# EasyEDA Pro project Rear_ESP32S3_R26.epro, schematic Rear_Mainboard_ESP32S3_V0.3, sheets 3 to 5 of 5

## Sheets
3 03_GSR_AFE_ADC: Schematic Name: Rear_Mainboard_V0.1
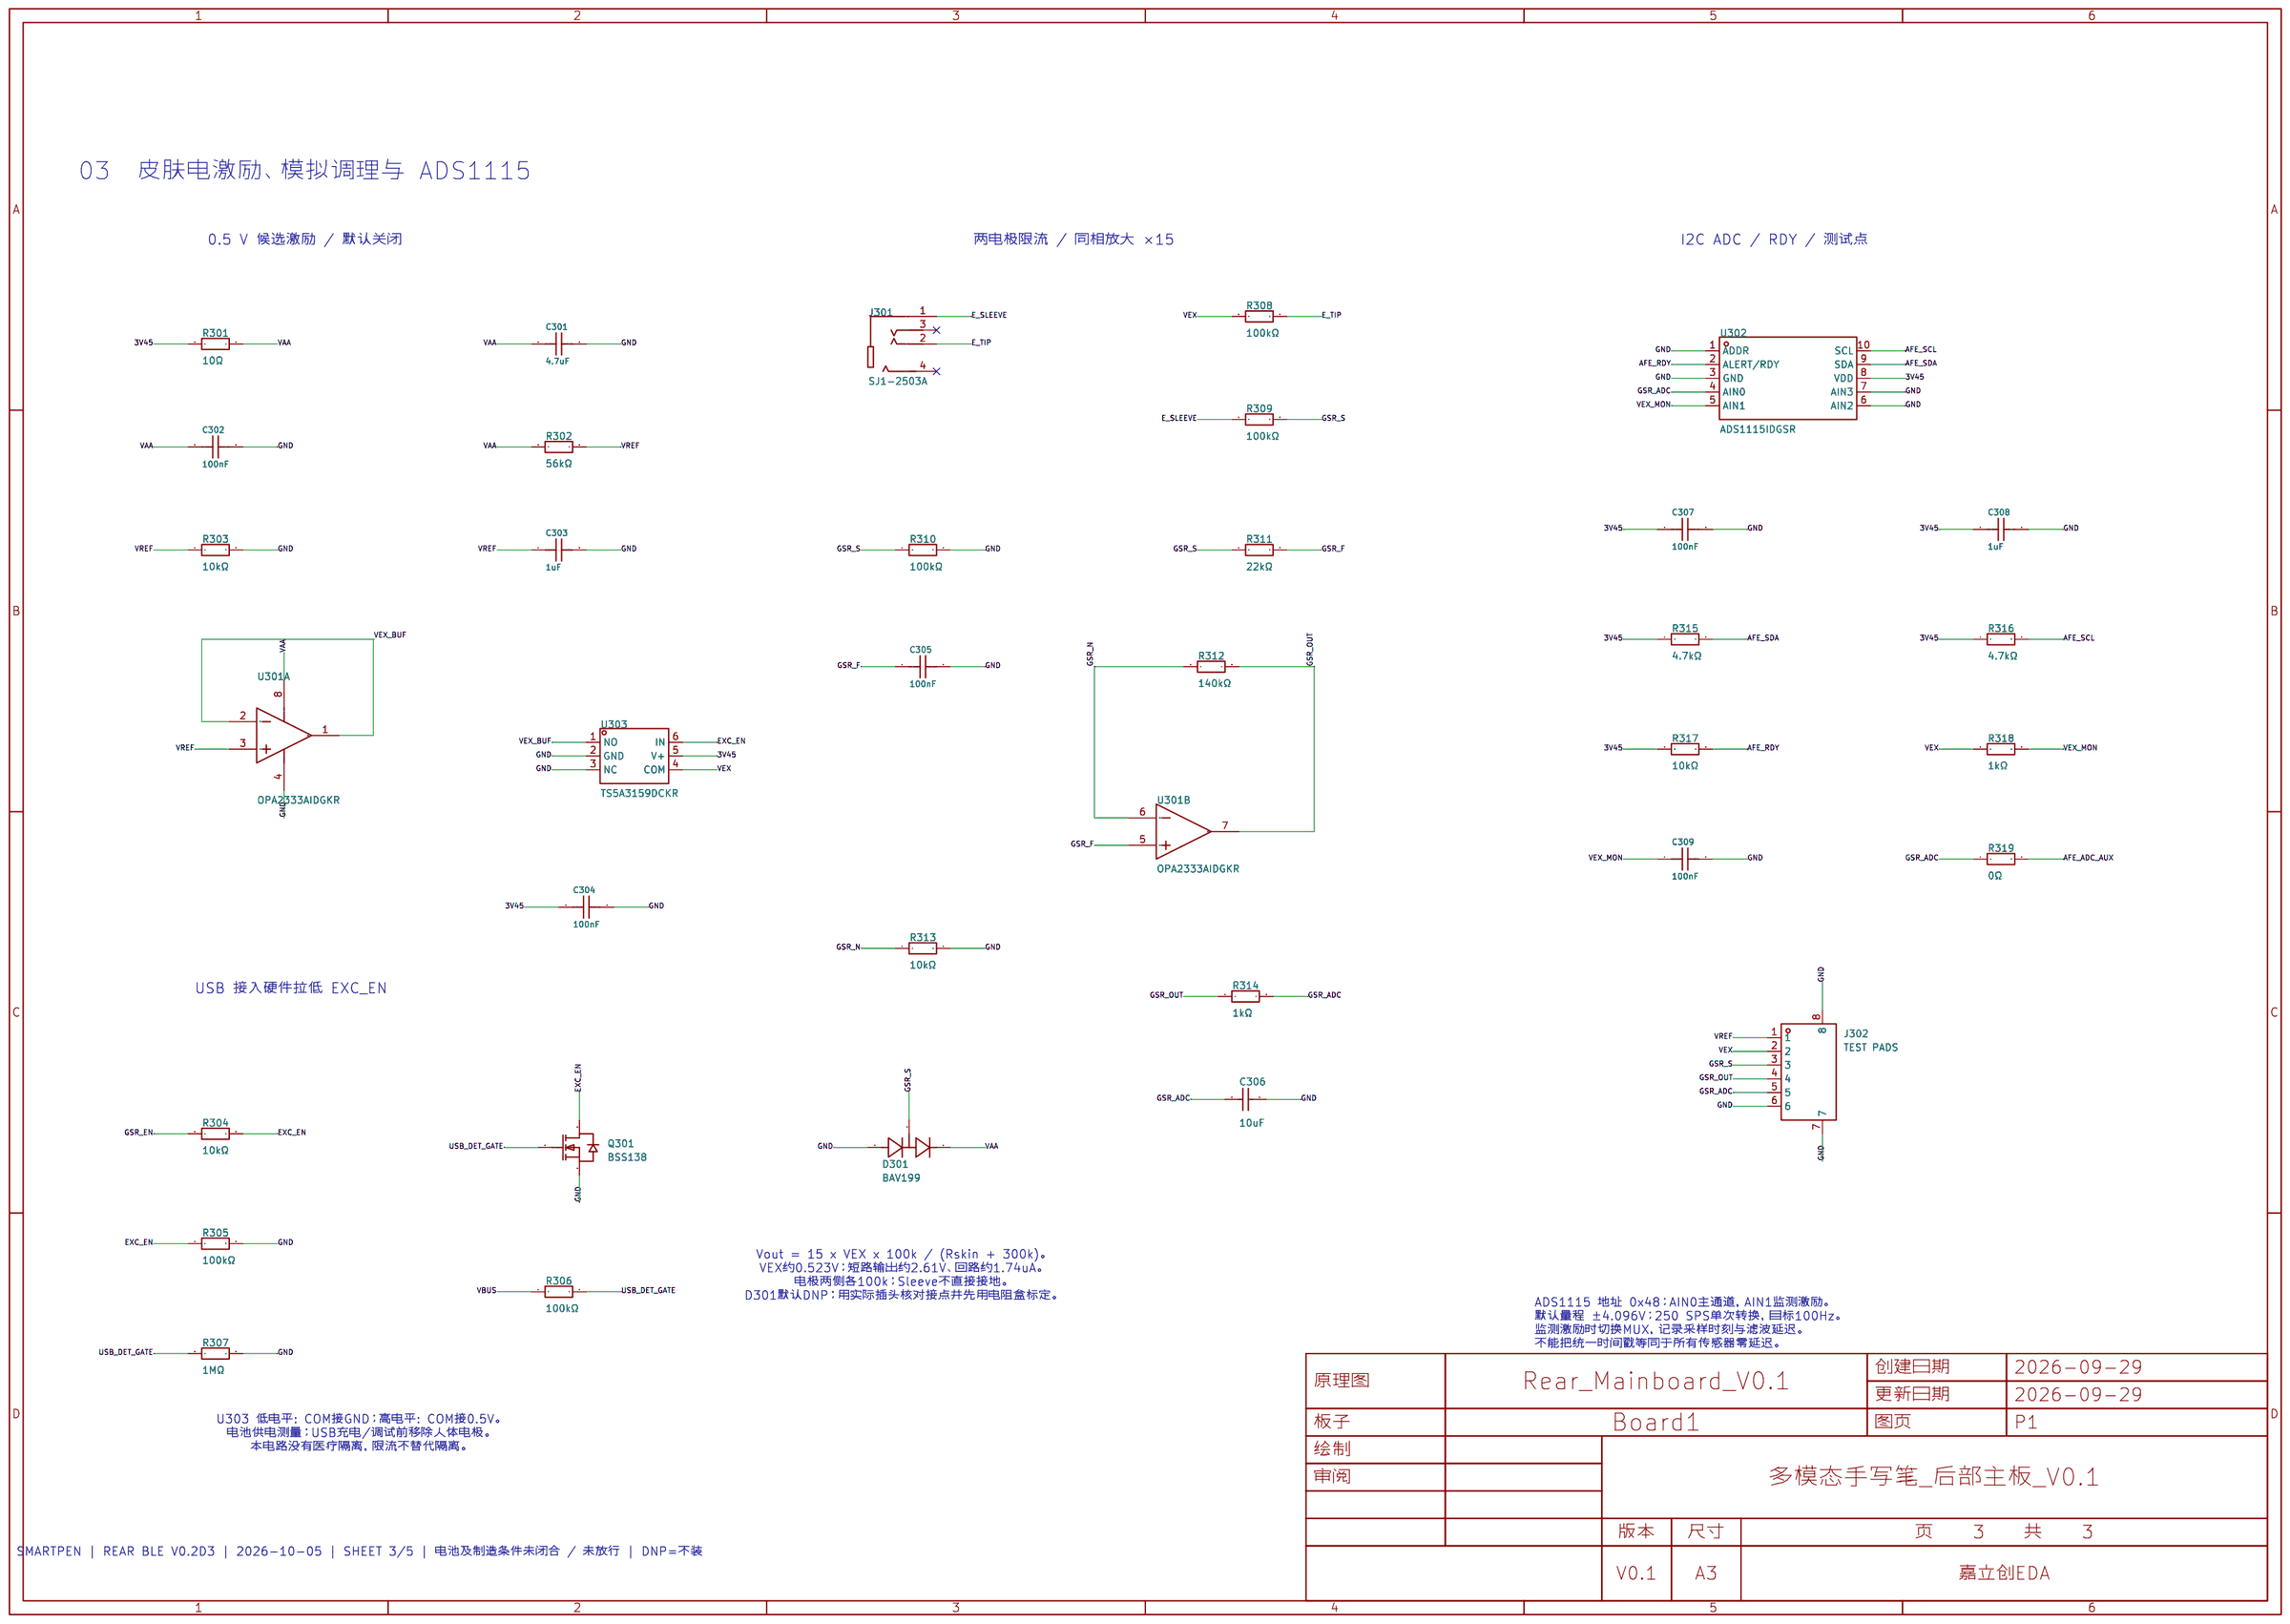
[diagram p2: 03_GSR_AFE_ADC]
4 04_Sensors: Schematic Name: Rear_Mainboard_V0.1
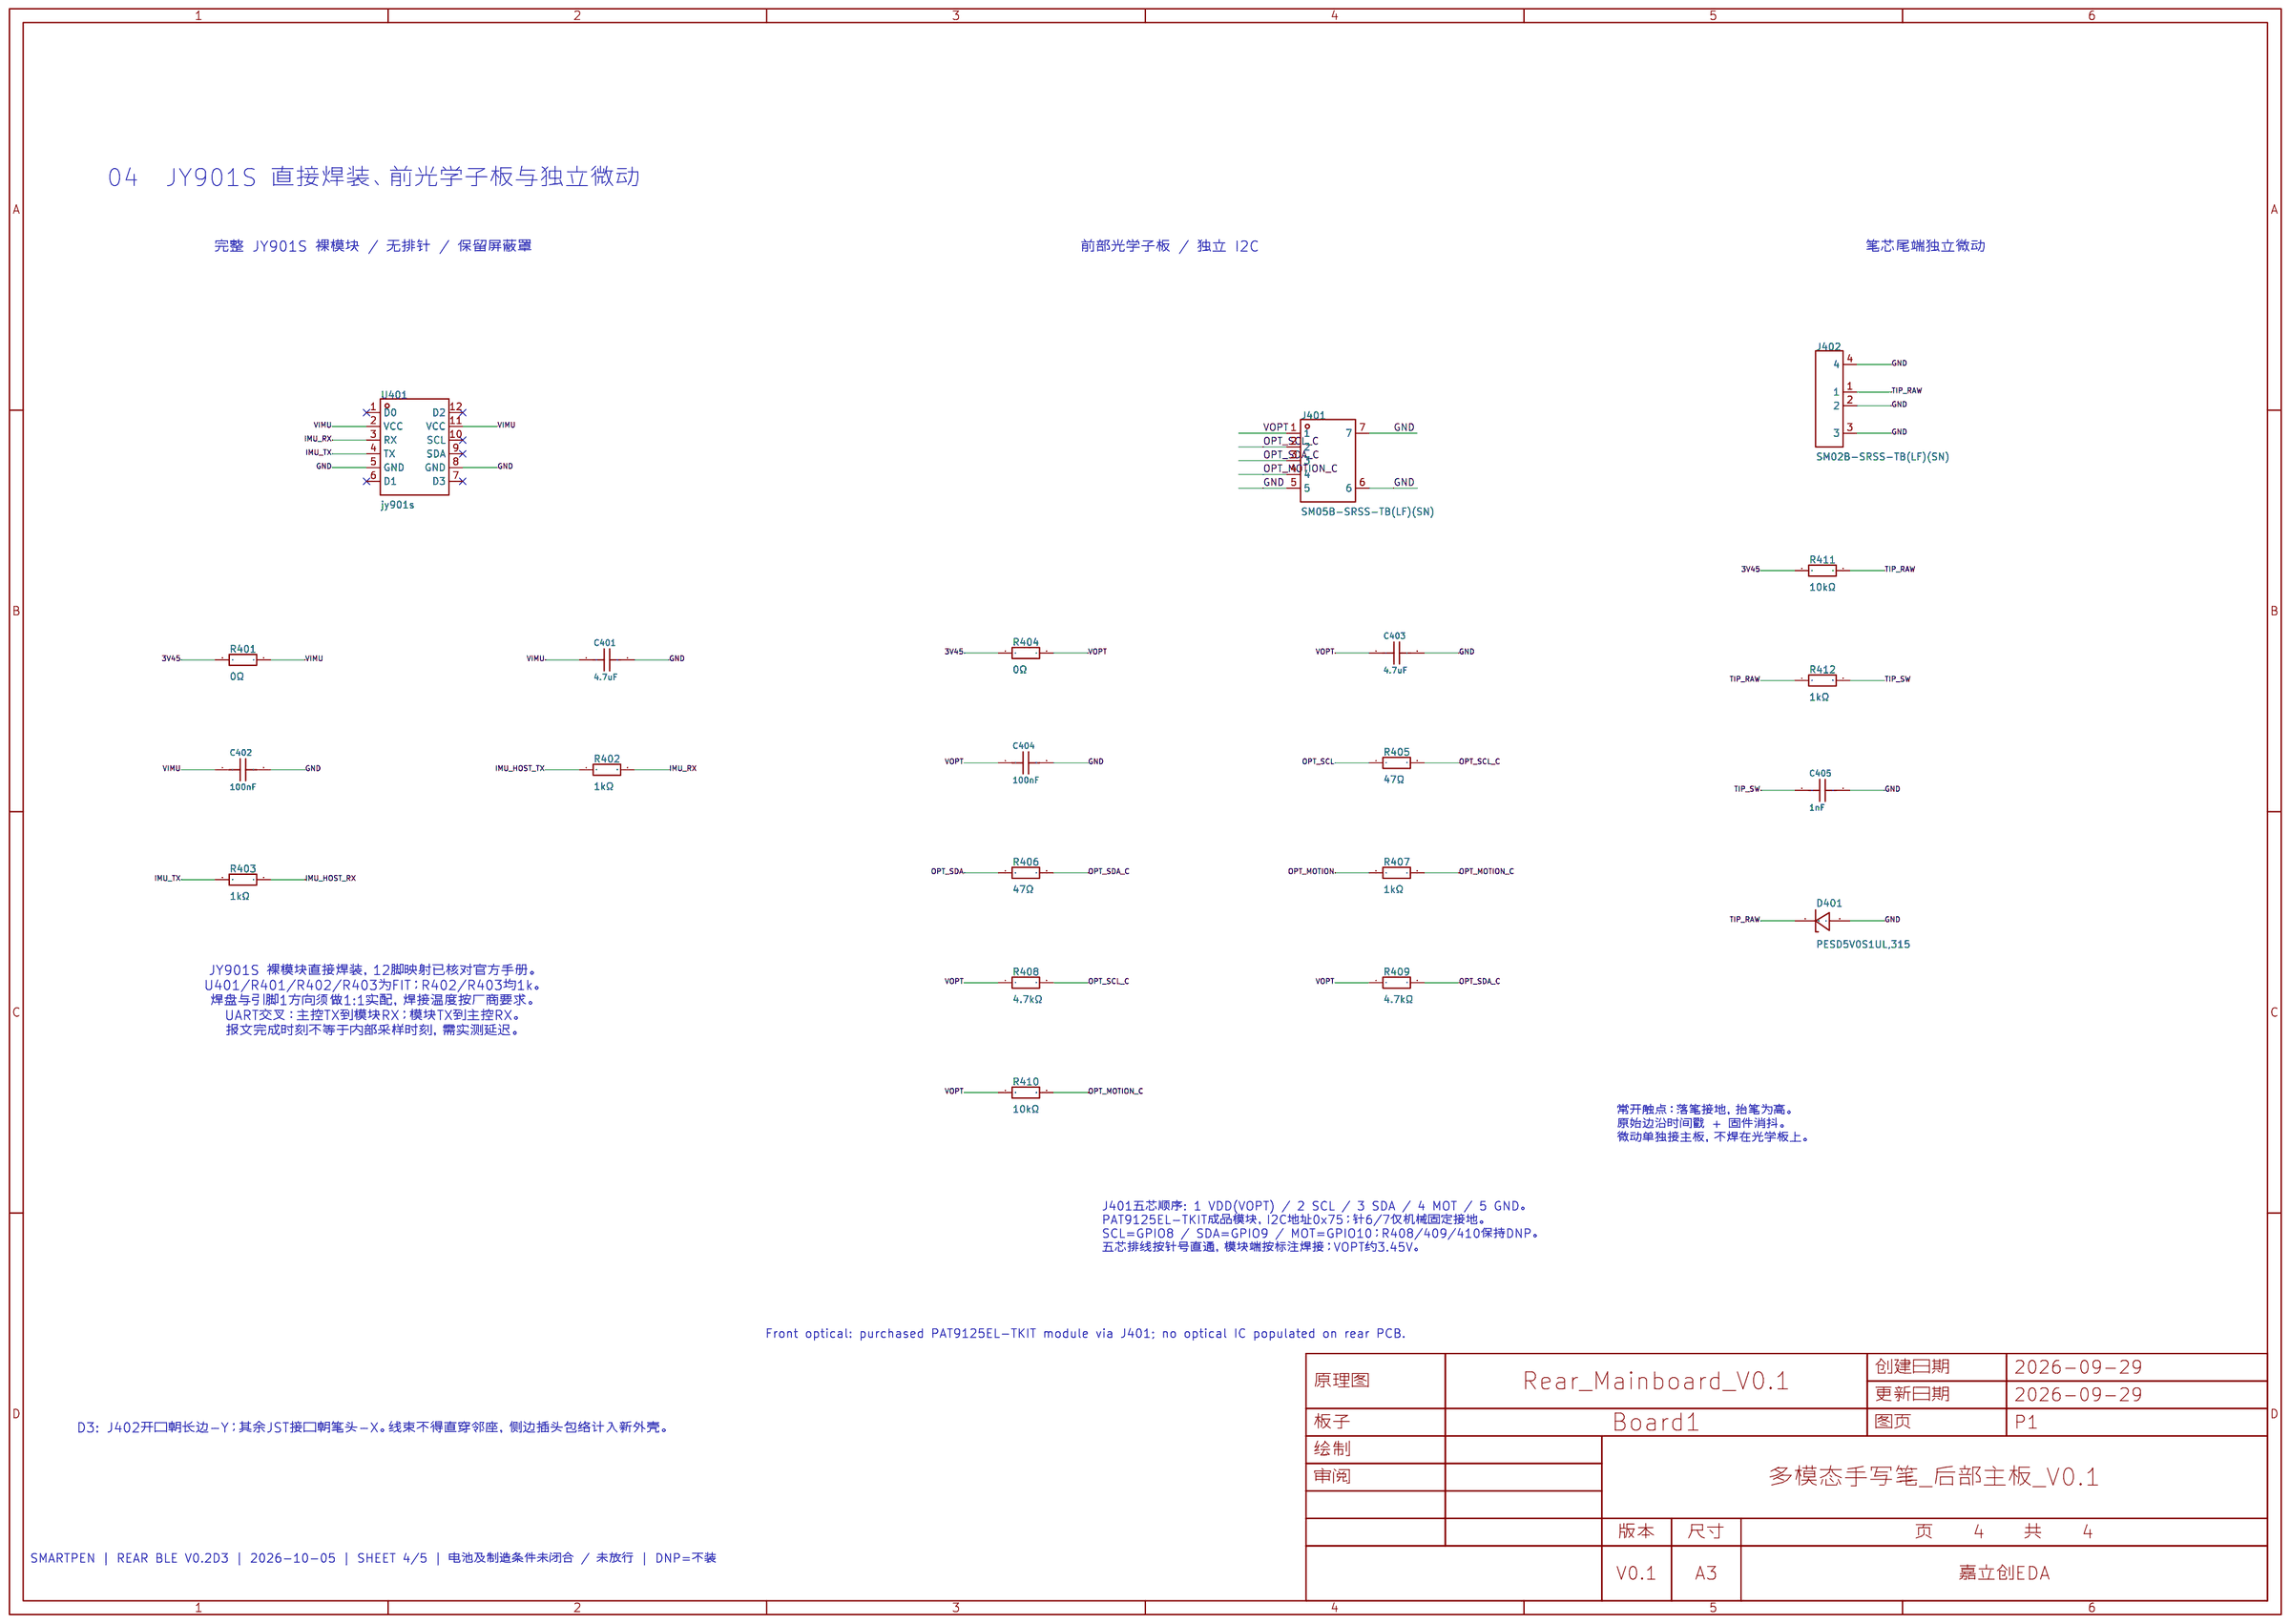
[diagram p3: 04_Sensors]
5 05_Status_Debug: Create Date: 2026-10-06; Schematic Name: Rear_Mainboard_V0.1; Update Date: 2026-10-06
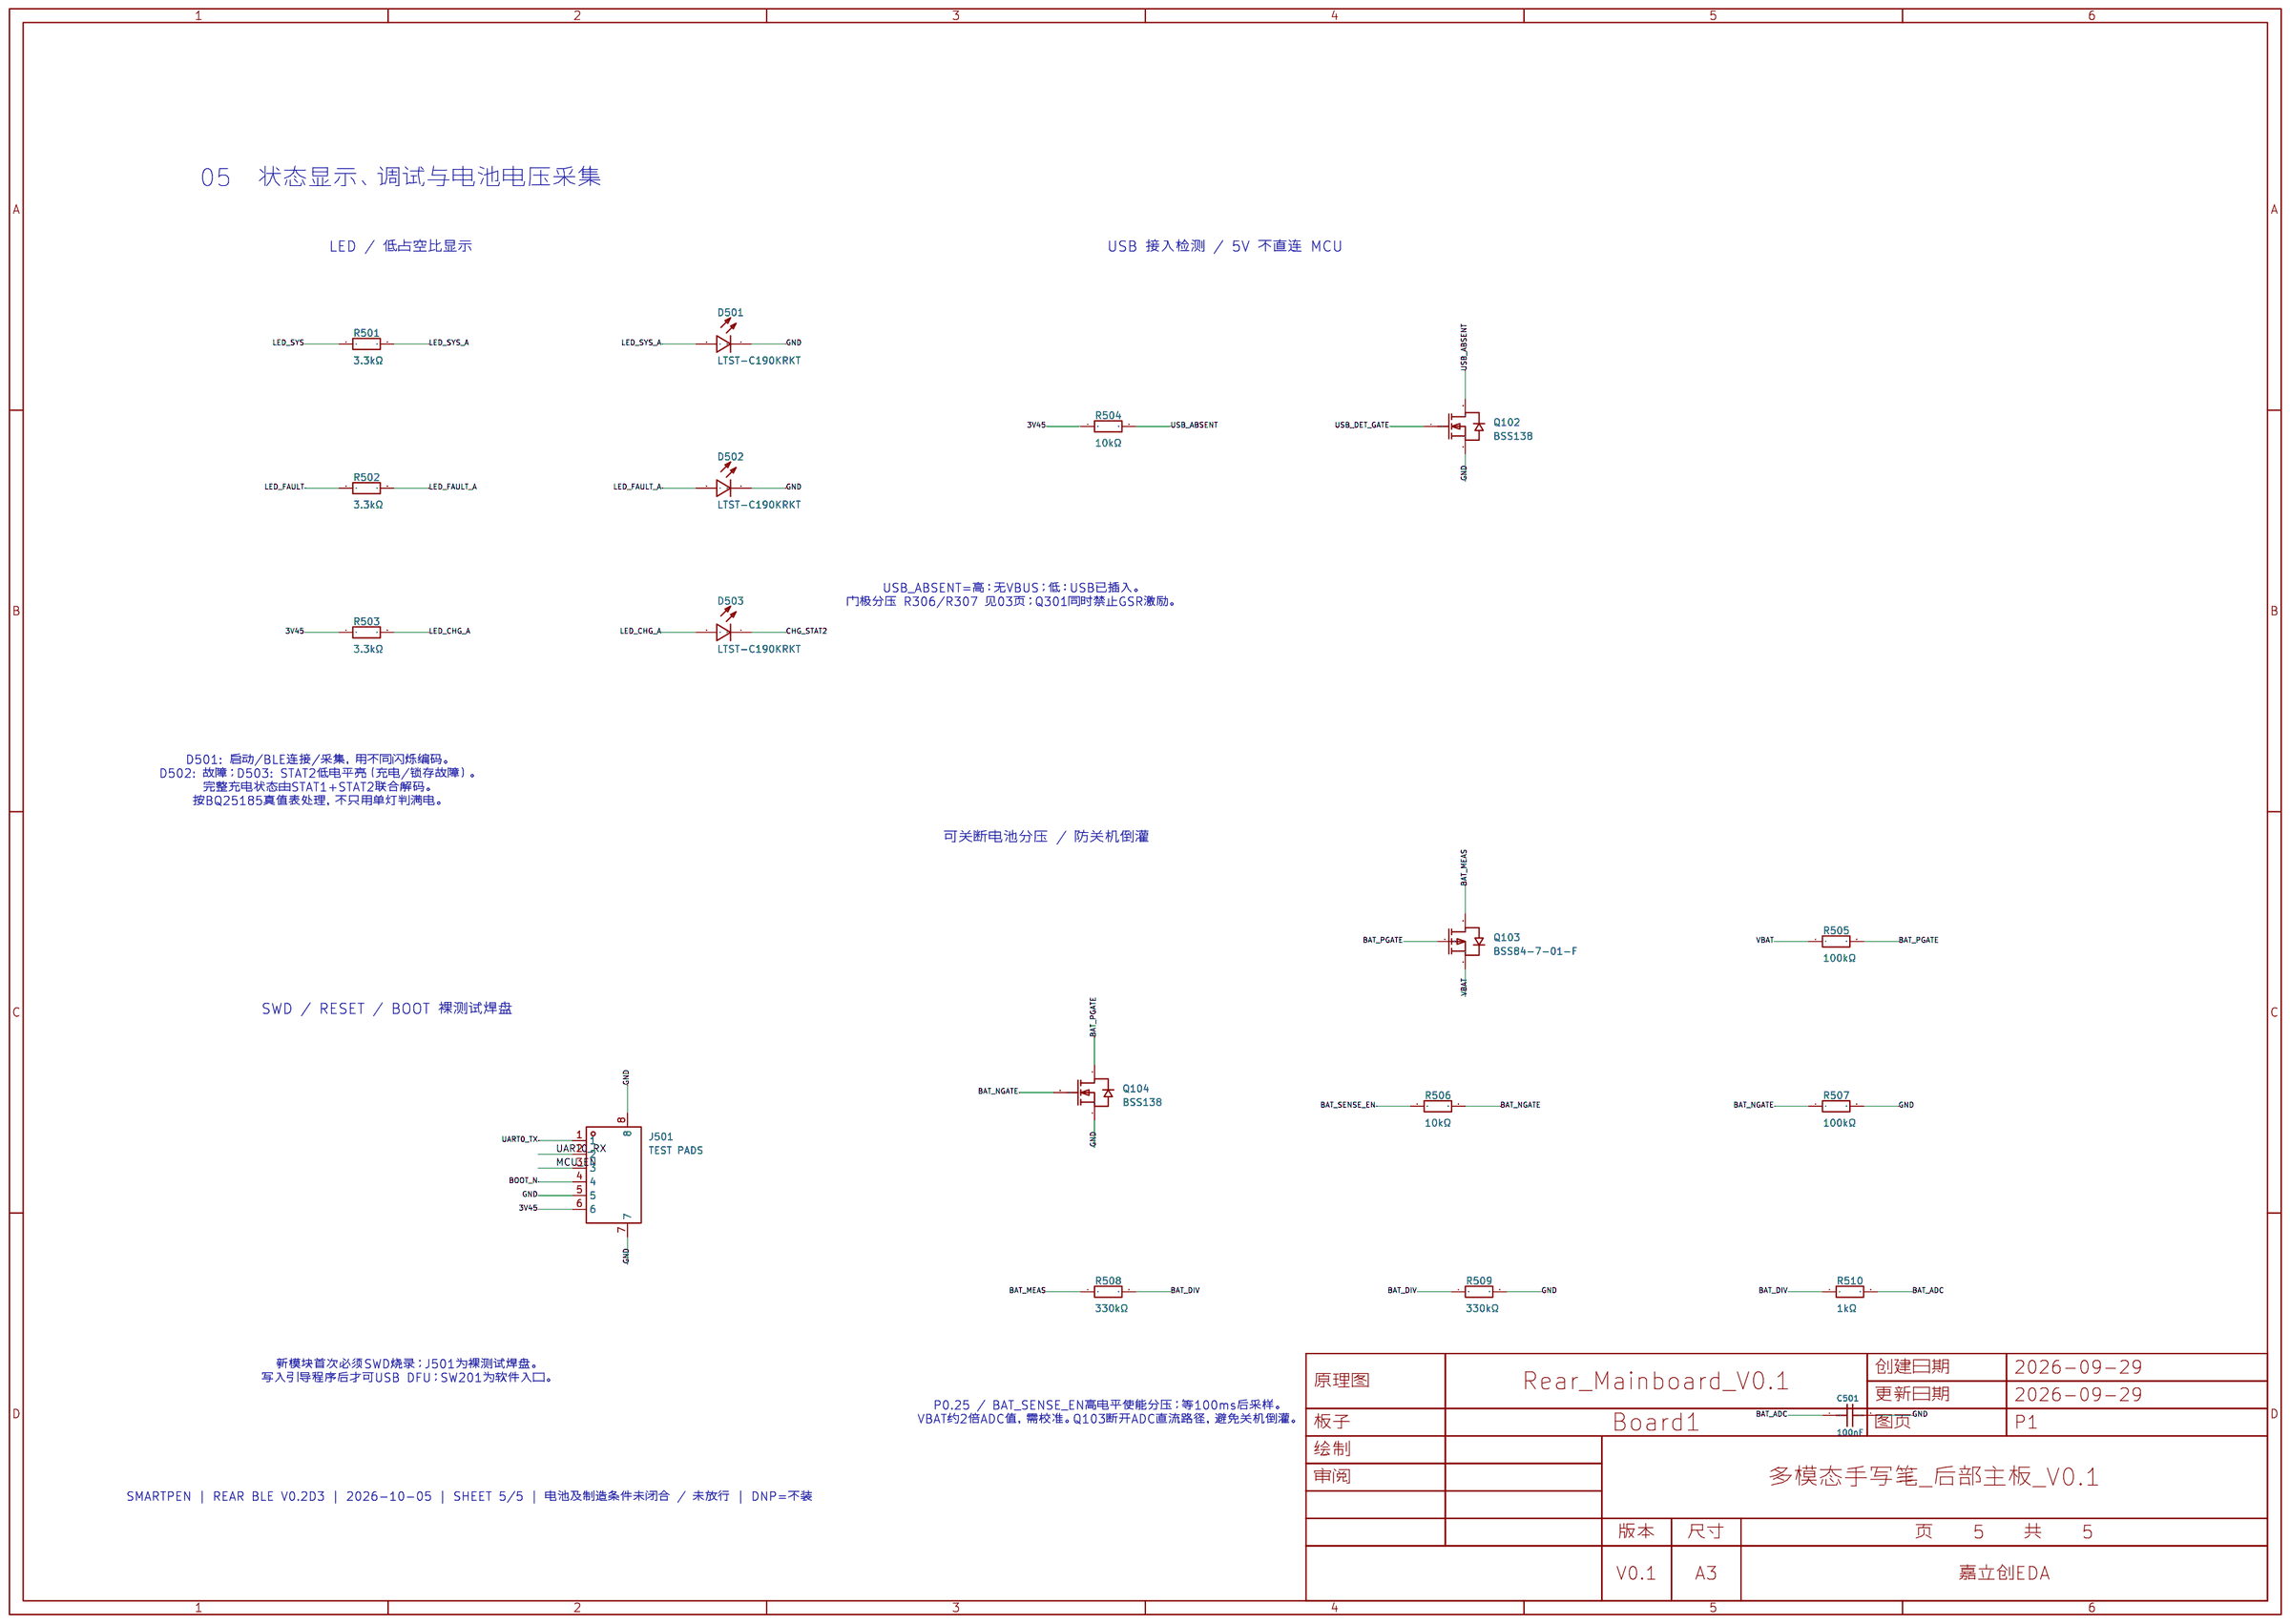
[diagram p4: 05_Status_Debug]

## Parts
sheet 03_GSR_AFE_ADC
C301  4.7uF  [C0603]
C302  100nF  [C0603]
C303  1uF  [C0603]
C304  100nF  [C0603]
C305  100nF  [C0603]
C306  10uF  [C0805]
C307  100nF  [C0603]
C308  1uF  [C0603]
C309  100nF  [C0603]
D301  BAV199  [SOT-23-3_L2.9-W1.3-P1.90-LS2.4-BR]  (no BOM)
J301  SJ1-2503A  [AUDIO-TH_SJ1-2503A]
J302  TEST PADS  [SMARTPEN_J302_TEST_8P_P1.27]  (no BOM)
Q301  BSS138  [SOT-23-3_L3.0-W1.7-P0.95-LS2.9-BR]
R301  10Ω  [R0603]
R302  56kΩ  [R0603]
R303  10kΩ  [R0603]
R304  10kΩ  [R0603]
R305  100kΩ  [R0603]
R306  100kΩ  [R0603]
R307  1MΩ  [R0603]
R308  100kΩ  [R0603]
R309  100kΩ  [R0603]
R310  100kΩ  [R0603]
R311  22kΩ  [R0603]
R312  140kΩ  [R0603]
R313  10kΩ  [R0603]
R314  1kΩ  [R0603]
R315  4.7kΩ  [R0603]
R316  4.7kΩ  [R0603]
R317  10kΩ  [R0603]
R318  1kΩ  [R0603]
R319  0Ω  [R0603]  (no BOM)
U301  OPA2333AIDGKR  [MSOP-8_L3.0-W3.0-P0.65-LS5.0-BL]  (sections 1,2)
U302  ADS1115IDGSR  [MSOP-10_L3.0-W3.0-P0.50-LS5.0-BL]
U303  TS5A3159DCKR  [SC-70-6_L2.0-W1.3-P0.65-LS2.1-BL-1]
sheet 04_Sensors
C401  4.7uF  [C0603]
C402  100nF  [C0603]
C403  4.7uF  [C0603]
C404  100nF  [C0603]
C405  1nF  [C0603]  (no BOM)
D401  PESD5V0S1UL,315  [SOD-882_L1.0-W0.6-RD]
J401  SM05B-SRSS-TB(LF)(SN)  [CONN-SMD_SM05B-SRSS-TB-LF-SN]
J402  SM02B-SRSS-TB(LF)(SN)  [CONN-SMD_2P-P1.00_SM02B-SRSS-TB-LF-SN]
R401  0Ω  [R0603]
R402  1kΩ  [R0603]
R403  1kΩ  [R0603]
R404  0Ω  [R0603]
R405  47Ω  [R0603]
R406  47Ω  [R0603]
R407  1kΩ  [R0603]
R408  4.7kΩ  [R0603]  (no BOM)
R409  4.7kΩ  [R0603]  (no BOM)
R410  10kΩ  [R0603]  (no BOM)
R411  10kΩ  [R0603]
R412  1kΩ  [R0603]
U401  jy901s  [COMM-SMD_JY901S-1]
sheet 05_Status_Debug
C501  100nF  [C0603]
D501  LTST-C190KRKT  [LED0603-RD]
D502  LTST-C190KRKT  [LED0603-RD]
D503  LTST-C190KRKT  [LED0603-RD]
J501  TEST PADS  [SMARTPEN_J501_TEST_8P_P1.27]  (no BOM)
Q102  BSS138  [SOT-23-3_L3.0-W1.7-P0.95-LS2.9-BR]
Q103  BSS84-7-01-F  [SOT-23-3_L2.9-W1.3-P1.90-LS2.3-BR]
Q104  BSS138  [SOT-23-3_L3.0-W1.7-P0.95-LS2.9-BR]
R501  3.3kΩ  [R0603]
R502  3.3kΩ  [R0603]
R503  3.3kΩ  [R0603]
R504  10kΩ  [R0603]
R505  100kΩ  [R0603]
R506  10kΩ  [R0603]
R507  100kΩ  [R0603]
R508  330kΩ  [R0603]
R509  330kΩ  [R0603]
R510  1kΩ  [R0603]

## Library data of the parts
C301 C401 C403 = GRM188R61A475KE15D: 容值:4.7uF;精度:±10%;额定电压:10V;材质(温度系数):X5R;; LCSC Part Name: 4.7uF ±10% 10V; Supplier Part: C71633; Manufacturer: muRata(村田); Supplier Footprint: 0603; JLCPCB Part Class: Extended Part; Datasheet: https://atta.szlcsc.com/upload/public/pdf/source/20161108/1478586449961.pdf; Supplier: LCSC; Tolerance: ±10%; Voltage Rating: 50V; Temperature Coefficient: X5R; Voltage Rated: 10V; Review: MPN selected from EDA library; electrical/stock and final assembly validation recorded separately; PCB Layer: Default; Assembly: FIT; DesignValue: 4.7uF 10V
C302 C304 C305 C307 C309 C402 C404 C501 = GRM188R71C104KA01D: 容值:100nF;精度:±10%;额定电压:16V;材质(温度系数):X7R;; LCSC Part Name: 100nF ±10% 16V; Supplier Part: C45000; Manufacturer: muRata(村田); Supplier Footprint: 0603; JLCPCB Part Class: Extended Part; Datasheet: https://atta.szlcsc.com/upload/public/pdf/source/20161108/1478586365848.pdf; Supplier: LCSC; Tolerance: ±10%; Voltage Rating: 50V; Temperature Coefficient: X7R; Voltage Rated: 16V; Review: MPN selected from EDA library; electrical/stock and final assembly validation recorded separately; PCB Layer: Default; Assembly: FIT
C303 C308 = GRM188R71C105KA12D: 容值:1uF;精度:±10%;额定电压:16V;材质(温度系数):X7R;; LCSC Part Name: 1uF ±10% 16V; Supplier Part: C97890; Manufacturer: muRata(村田); Supplier Footprint: 0603; JLCPCB Part Class: Extended Part; Datasheet: https://atta.szlcsc.com/upload/public/pdf/source/20170310/1489116375128.pdf; Supplier: LCSC; Tolerance: ±10%; Voltage Rating: 50V; Temperature Coefficient: X7R; Voltage Rated: 16V; Review: MPN selected from EDA library; electrical/stock and final assembly validation recorded separately; PCB Layer: Default; Assembly: FIT
C306 = GRM21BR61A106KE19L: 容值:10uF;精度:±10%;额定电压:10V;温度系数:X5R;; LCSC Part Name: 10uF ±10% 10V; Supplier Part: C77073; Manufacturer: muRata(村田); Supplier Footprint: 0805; JLCPCB Part Class: Extended Part; Datasheet: https://item.szlcsc.com/datasheet/GRM21BR61A106KE19L/78200.html; Supplier: LCSC; Tolerance: ±10%; Voltage Rating: 10V; Temperature Coefficient: X5R; Review: MPN selected from EDA library; electrical/stock and final assembly validation recorded separately; PCB Layer: Default; Assembly: FIT; DesignValue: 10uF 10V
D301 = BAV199: 二极管配置:1对串联式;整流电流:215mA;直流反向耐压(Vr):100V;正向压降(Vf):1.25V@150mA;反向恢复时间(Trr):3us;; LCSC Part Name: 100V 215mA; Supplier Part: C699080; Manufacturer: YANGJIE(扬杰); Supplier Footprint: SOT-23(TO-236); JLCPCB Part Class: Extended Part; Datasheet: https://item.szlcsc.com/datasheet/BAV199/733772.html; Supplier: LCSC; Diode Configuration: 1对串联式; Pd - Power Dissipation: 250mW; Current - Rectified: 215mA; Voltage - DC Reverse(Vr): 100V; Voltage - Forward(Vf@If): 1.25V@150mA; Non-Repetitive Peak Forward Surge Current: 4A; Reverse Leakage Current (Ir): 5nA@75V; Reverse Recovery Time (trr): 3us; PCB Layer: Default; Assembly: DNP; Review: BAV199 leakage and pinout to verify; initially DNP
J301 = SJ1-2503A: 连接器类型:2.5mm耳机座;额定电流:1A;额定电压:12V;触头材质:黄铜；铜合金;触头镀层:锡;工作温度:-25℃~+85℃;; LCSC Part Name: 2.5mm耳机座; Supplier Part: C4991647; Manufacturer: CUI; Supplier Footprint: 插件,5x7.8mm; JLCPCB Part Class: Extended Part; Datasheet: https://item.szlcsc.com/datasheet/SJ1-2503A/5566518.html; Supplier: LCSC; Connector Type: 2.5mm耳机座; Current Rating: 1A; Voltage Rating (Max): 12V; Contact Material: 黄铜；铜合金; Contact Plating: 锡; Operating Temperature: -25℃~+85℃; Rank Number: TRRS; Mounting Style: 弯插; Color: 黑色; Body Height: 5mm; Length: 10.8mm; Width: 5mm; PCB Layer: Default; Assembly: FIT; Review: 2.5mm TS assumed; physical fit and contact mapping must be checked
J302 = SMARTPEN_J302_TEST_8P_P1.27: PCB exposed copper test pads; no purchased component; LCSC Part Name: 1x6P 间距:1mm 卧贴 系列:SH; Manufacturer: PCB copper; Supplier Footprint: SMD,P=1mm,卧贴; JLCPCB Part Class: Extended Part; Datasheet: https://item.szlcsc.com/datasheet/SM06B-SRSS-TB(LF)(SN)/171785.html; Supplier: Not purchased; Pins Structure: 1x6P; Pitch: 1mm; Mounting Type: 卧贴; Reference Series: SH; Number of Pins: 6P; Number of Rows: 1; Number of PINs Per Row: 6; Current Rating: 1A; Contact Material: 铜合金; Contact Plating: 锡; Operating Temperature: -25℃~+85℃; Voltage Rating: 50V; Plastic Material: PA; Flame Retardant Rating: UL94V-0; Supplementary Features: 辅助焊脚; Color: 白色; Z-Height of the Board: 2.9mm; X-Length of Bottom Edge on Board (Spacing Line): 8mm; Y-Width of Bottom Edge on Board: 4.32mm; Assembly: PCB_ONLY; PCB Layer: Default; Review: Bare analog test pads; not a purchased connector. See pin labels in schematic.
Q102 Q104 Q301 = BSS138: 数量:1个N沟道;漏源电压(Vdss):50V;连续漏极电流(Id):220mA;导通电阻(RDS(on)):4Ω@4.5V;耗散功率(Pd):350mW;阈值电压(Vgs(th)):1.6V;; LCSC Part Name: 1个N沟道 耐压:50V 电流:0.22A; Supplier Part: C193019; Manufacturer: AnBon(安邦); Supplier Footprint: SOT-23; JLCPCB Part Class: Extended Part; Datasheet: https://item.szlcsc.com/datasheet/BSS138/226058.html; Supplier: LCSC; Number: 1个N沟道; Drain to Source Voltage: 50V; Current - Continuous Drain(Id): 220mA; RDS(on): 4Ω@4.5V; Pd - Power Dissipation: 350mW; Gate Threshold Voltage (Vgs(th)): 1.6V; Input Capacitance(Ciss): 27pF; Reverse Transfer Capacitance (Crss@Vds): 6pF; Type: N沟道; Output Capacitance(Coss): 13pF; Vgs: ±20V; PCB Layer: Default; Assembly: FIT; Review: Engineering draft; MPN and footprint require review
R301 = RC0603FR-0710RL: 电阻类型:厚膜电阻;阻值:10Ω;精度:±1%;功率:100mW;工作电压:75V;温度系数:±200ppm/℃;; LCSC Part Name: 厚膜电阻 10Ω ±1% 100mW; Supplier Part: C109318; Manufacturer: YAGEO(国巨); Supplier Footprint: 0603; JLCPCB Part Class: Extended Part; Datasheet: https://item.szlcsc.com/datasheet/RC0603FR-0710RL/110539.html; Supplier: LCSC; Type: 厚膜电阻; Tolerance: ±1%; Power(Watts): 100mW; Voltage-Supply(Max): 75V; Temperature Coefficient: ±200ppm/℃; Operating Temperature: -55℃~+155℃; Review: MPN selected from EDA library; electrical/stock and final assembly validation recorded separately; PCB Layer: Default; Assembly: FIT; DesignValue: 10R
R302 = RT0603BRD0756KL: 电阻类型:薄膜电阻;阻值:56kΩ;精度:±0.1%;功率:100mW;工作电压:75V;温度系数:±25ppm/℃;; LCSC Part Name: 薄膜电阻 56kΩ ±0.1% 100mW; Supplier Part: C705785; Manufacturer: YAGEO(国巨); Supplier Footprint: 0603; JLCPCB Part Class: Extended Part; Datasheet: https://item.szlcsc.com/datasheet/RT0603BRD0756KL/742305.html; Supplier: LCSC; Type: 薄膜电阻; Tolerance: ±0.1%; Power(Watts): 100mW; Voltage-Supply(Max): 75V; Temperature Coefficient: ±25ppm/℃; Operating Temperature: -55℃~+155℃; Review: MPN selected from EDA library; electrical/stock and final assembly validation recorded separately; PCB Layer: Default; Assembly: FIT; DesignValue: 56k 0.1%
R303 R313 = RT0603BRD0710KL: 电阻类型:薄膜电阻;阻值:10kΩ;精度:±0.1%;功率:100mW;工作电压:75V;温度系数:±25ppm/℃;; LCSC Part Name: 薄膜电阻 10kΩ ±0.1% 100mW; Supplier Part: C95204; Manufacturer: YAGEO(国巨); Supplier Footprint: 0603; JLCPCB Part Class: Extended Part; Datasheet: https://item.szlcsc.com/datasheet/RT0603BRD0710KL/96405.html; Supplier: LCSC; Type: 薄膜电阻; Tolerance: ±0.1%; Power(Watts): 100mW; Voltage-Supply(Max): 75V; Temperature Coefficient: ±25ppm/℃; Operating Temperature: -55℃~+155℃; Review: MPN selected from EDA library; electrical/stock and final assembly validation recorded separately; PCB Layer: Default; Assembly: FIT; DesignValue: 10k 0.1%
R304 R317 R411 R504 R506 = RC0603FR-0710KL: 电阻类型:厚膜电阻;阻值:10kΩ;精度:±1%;功率:100mW;工作电压:75V;温度系数:±100ppm/℃;; LCSC Part Name: 厚膜电阻 10kΩ ±1% 100mW; Supplier Part: C98220; Manufacturer: YAGEO(国巨); Supplier Footprint: 0603; JLCPCB Part Class: Extended Part; Datasheet: https://item.szlcsc.com/datasheet/RC0603FR-0710KL/99429.html; Supplier: LCSC; Type: 厚膜电阻; Tolerance: ±1%; Power(Watts): 100mW; Voltage-Supply(Max): 75V; Temperature Coefficient: ±100ppm/℃; Operating Temperature: -55℃~+155℃; Review: MPN selected from EDA library; electrical/stock and final assembly validation recorded separately; PCB Layer: Default; Assembly: FIT; DesignValue: 10k
R305 R306 R505 R507 = RC0603FR-07100KL: 电阻类型:厚膜电阻;阻值:100kΩ;精度:±1%;功率:100mW;工作电压:75V;温度系数:±100ppm/℃;; LCSC Part Name: 厚膜电阻 100kΩ ±1%; Supplier Part: C14675; Manufacturer: YAGEO(国巨); Supplier Footprint: 0603; JLCPCB Part Class: Extended Part; Datasheet: https://item.szlcsc.com/datasheet/RC0603FR-07100KL/15343.html; Supplier: LCSC; Type: 厚膜电阻; Tolerance: ±1%; Power(Watts): 100mW; Voltage-Supply(Max): 75V; Temperature Coefficient: ±100ppm/℃; Operating Temperature: -55℃~+155℃; Review: MPN selected from EDA library; electrical/stock and final assembly validation recorded separately; PCB Layer: Default; Assembly: FIT; DesignValue: 100k
R307 = RC0603FR-071ML: 电阻类型:厚膜电阻;阻值:1MΩ;精度:±1%;功率:100mW;工作电压:75V;温度系数:±100ppm/℃;; LCSC Part Name: 厚膜电阻 1MΩ ±1% 100mW; Supplier Part: C105578; Manufacturer: YAGEO(国巨); Supplier Footprint: 0603; JLCPCB Part Class: Extended Part; Datasheet: https://item.szlcsc.com/datasheet/RC0603FR-071ML/106793.html; Supplier: LCSC; Type: 厚膜电阻; Tolerance: ±1%; Power(Watts): 100mW; Voltage-Supply(Max): 75V; Temperature Coefficient: ±100ppm/℃; Operating Temperature: -55℃~+155℃; Review: MPN selected from EDA library; electrical/stock and final assembly validation recorded separately; PCB Layer: Default; Assembly: FIT; DesignValue: 1M
R308-R310 = RT0603BRD07100KL: 电阻类型:薄膜电阻;阻值:100kΩ;精度:±0.1%;功率:100mW;最大工作电压:75V;温度系数:±25ppm/℃;; LCSC Part Name: 薄膜电阻 100kΩ ±0.1% 100mW; Supplier Part: C122538; Manufacturer: YAGEO(国巨); Supplier Footprint: 0603; JLCPCB Part Class: Extended Part; Datasheet: https://atta.szlcsc.com/upload/public/pdf/source/20170721/C122538_1500619326323834092.pdf; Supplier: LCSC; Type: 薄膜电阻; Tolerance: ±0.1%; Power(Watts): 100mW; Voltage-Supply(Max): 75V; Temperature Coefficient: ±25ppm/℃; Operating Temperature: -55℃~+155℃; Overload Voltage (Max): 75V; Operating Temperature Range: -55℃~+155℃; Review: MPN selected from EDA library; electrical/stock and final assembly validation recorded separately; PCB Layer: Default; Assembly: FIT; DesignValue: 100k 0.1%
R311 = RC0603FR-0722KL: 电阻类型:厚膜电阻;阻值:22kΩ;精度:±1%;功率:100mW;工作电压:75V;温度系数:±100ppm/℃;; LCSC Part Name: 厚膜电阻 22kΩ ±1% 100mW; Supplier Part: C114065; Manufacturer: YAGEO(国巨); Supplier Footprint: 0603; JLCPCB Part Class: Extended Part; Datasheet: https://item.szlcsc.com/datasheet/RC0603FR-0722KL/115304.html; Supplier: LCSC; Type: 厚膜电阻; Tolerance: ±1%; Power(Watts): 100mW; Voltage-Supply(Max): 75V; Temperature Coefficient: ±100ppm/℃; Operating Temperature: -55℃~+155℃; Review: MPN selected from EDA library; electrical/stock and final assembly validation recorded separately; PCB Layer: Default; Assembly: FIT; DesignValue: 22k
R312 = RT0603BRD07140KL: 电阻类型:薄膜电阻;阻值:140kΩ;精度:±0.1%;功率:100mW;工作电压:75V;温度系数:±25ppm/℃;; LCSC Part Name: 薄膜电阻 140kΩ ±0.1% 100mW; Supplier Part: C861125; Manufacturer: YAGEO(国巨); Supplier Footprint: 0603; JLCPCB Part Class: Extended Part; Datasheet: https://item.szlcsc.com/datasheet/RT0603BRD07140KL/921463.html; Supplier: LCSC; Type: 薄膜电阻; Tolerance: ±0.1%; Power(Watts): 100mW; Voltage-Supply(Max): 75V; Temperature Coefficient: ±25ppm/℃; Operating Temperature: -55℃~+155℃; Review: MPN selected from EDA library; electrical/stock and final assembly validation recorded separately; PCB Layer: Default; Assembly: FIT; DesignValue: 140k 0.1%
R314 R318 R402 R403 R407 R412 R510 = RC0603FR-071KL: 电阻类型:厚膜电阻;阻值:1kΩ;精度:±1%;功率:100mW;工作电压:75V;温度系数:±100ppm/℃;; LCSC Part Name: 厚膜电阻 1kΩ ±1%; Supplier Part: C22548; Manufacturer: YAGEO(国巨); Supplier Footprint: 0603; JLCPCB Part Class: Extended Part; Datasheet: https://item.szlcsc.com/datasheet/RC0603FR-071KL/23274.html; Supplier: LCSC; Type: 厚膜电阻; Tolerance: ±1%; Power(Watts): 100mW; Voltage-Supply(Max): 75V; Temperature Coefficient: ±100ppm/℃; Operating Temperature: -55℃~+155℃; Review: MPN selected from EDA library; electrical/stock and final assembly validation recorded separately; PCB Layer: Default; Assembly: FIT; DesignValue: 1k
R315 R316 = RC0603FR-074K7L: 电阻类型:厚膜电阻;阻值:4.7kΩ;精度:±1%;功率:100mW;工作电压:75V;温度系数:±100ppm/℃;; LCSC Part Name: 厚膜电阻 4.7kΩ ±1% 100mW; Supplier Part: C99782; Manufacturer: YAGEO(国巨); Supplier Footprint: 0603; JLCPCB Part Class: Extended Part; Datasheet: https://item.szlcsc.com/datasheet/RC0603FR-074K7L/100996.html; Supplier: LCSC; Type: 厚膜电阻; Tolerance: ±1%; Power(Watts): 100mW; Voltage-Supply(Max): 75V; Temperature Coefficient: ±100ppm/℃; Operating Temperature: -55℃~+155℃; Review: MPN selected from EDA library; electrical/stock and final assembly validation recorded separately; PCB Layer: Default; Assembly: FIT; DesignValue: 4.7k
R319 = RC0603JR-070RL: 电阻类型:厚膜电阻;阻值:0Ω;精度:±5%;功率:100mW;工作电压:75V;温度系数:-;; LCSC Part Name: 厚膜电阻 0Ω ±5% 100mW; Supplier Part: C95177; Manufacturer: YAGEO(国巨); Supplier Footprint: 0603; JLCPCB Part Class: Extended Part; Datasheet: https://item.szlcsc.com/datasheet/RC0603JR-070RL/96378.html; Supplier: LCSC; Type: 厚膜电阻; Tolerance: ±5%; Power(Watts): 100mW; Voltage-Supply(Max): 75V; Operating Temperature: -55℃~+155℃; Review: MPN selected from EDA library; electrical/stock and final assembly validation recorded separately; PCB Layer: Default; Assembly: DNP; DesignValue: 0R DNP
U301 = OPA2333AIDGKR: 放大器数:双路;输入失调电压(Vos):2uV;增益带宽积(GBW):350kHz;轨到轨:轨到轨输入,轨到轨输出;压摆率(SR):0.16V/us;输入偏置电流(Ib):70pA;; LCSC Part Name: OPA2333AIDGKR  零漂移; Supplier Part: C19608; Manufacturer: TI(德州仪器); Supplier Footprint: VSSOP-8; JLCPCB Part Class: Extended Part; Datasheet: https://www.ti.com/cn/lit/ds/symlink/opa2333.pdf; Supplier: LCSC; Number of Channels: 双路; Single Supply: 1.8V~5.5V; Dual Supply: 900mV~2.75V；-2.75V~-900mV; Vos - Input Offset Voltage: 2uV; Input Offset Voltage Drift(Vos TC): 20nV/℃; Gain Bandwidth Product: 350kHz; Rail to Rail: 轨到轨输入,轨到轨输出; Slew Rate: 0.16V/us; Common Mode Rejection Ratio(CMRR): 106dB; Ib - Input Bias Current: 70pA; Quiescent Current(Iq): 17uA; Output Current: 5mA; Input Offset Current(Ios): 400pA; Operating Temperature: -40℃~+125℃; Features: ESD保护；内置补偿；零漂移/自动稳零；反相位输入保护；过压保护; PCB Layer: Default; Assembly: FIT; Review: Engineering draft; MPN and footprint require review
U302 = ADS1115IDGSR: 分辨率(位):16;采样率:860Hz;工作电压:2V~5.5V;接口类型:I2C;; LCSC Part Name: 具有内部基准、振荡器和可编程比较器且兼容 I2C 的ADS111x、超小型、低功耗 860SPS、16位ADC; Supplier Part: C37593; Manufacturer: TI(德州仪器); Supplier Footprint: VSSOP-10; JLCPCB Part Class: Extended Part; Datasheet: https://www.ti.com/cn/lit/ds/symlink/ads1115.pdf; Supplier: LCSC; Resolution (Bits): 16; Sampling Rate: 860Hz; number of channels: 2; Voltage - Supply: 2V~5.5V; Interface: I2C; differential input: 是; Integral non - linearity: 1LSB; Operating Temperature: -40℃~+125℃; Clock/Oscillator: 内置; Voltage Reference: 内置; Programmable Gain: 支持; ADC architecture: Sigma-Delta; Quiescent Current (Iq): 500nA; Features: 集成调制器；多路复用器；内置数字滤波器；上电复位; PCB Layer: Default; Assembly: FIT; Review: Engineering draft; MPN and footprint require review
U303 = TS5A3159DCKR: 开关电路:2:1;通道数:1;导通电阻(Ron):1Ω;; LCSC Part Name: TS5A3159 1-Q SPDT 模拟开关; Supplier Part: C46388; Manufacturer: TI(德州仪器); Supplier Footprint: SC-70-6(SOT-363); JLCPCB Part Class: Extended Part; Datasheet: https://www.ti.com/cn/lit/ds/symlink/ts5a3159.pdf; Supplier: LCSC; Switch Circuit: 2:1; Number of Channels: 1; Ron: 1Ω; Voltage - Supply: 1.65V~5.5V; Con: 84pF; Turn-on time: 20ns; Turn-off time: 15ns; Bandwidth: 100MHz; Operating Temperature: -40℃~+85℃; Features: 无毛刺切换; Charge Injection: 36pC; PCB Layer: Default; Assembly: FIT; Review: Engineering draft; MPN and footprint require review
C405 = GRM1885C1H102JA01D: 容值:1nF;精度:±5%;额定电压:50V;材质(温度系数):C0G;; LCSC Part Name: 1nF ±5% 50V; Supplier Part: C77026; Manufacturer: muRata(村田); Supplier Footprint: 0603; JLCPCB Part Class: Extended Part; Datasheet: https://atta.szlcsc.com/upload/public/pdf/source/20200305/C490387_23319AE8C154DEB24C505E6C82A8106A.pdf; Supplier: LCSC; Tolerance: ±5%; Voltage Rating: 50V; Temperature Coefficient: C0G; Voltage Rated: 50V; Review: MPN selected from EDA library; electrical/stock and final assembly validation recorded separately; PCB Layer: Default; Assembly: DNP; DesignValue: 1nF DNP
D401 = PESD5V0S1UL,315: 极性:单向;反向截止电压(Vrwm):5V;钳位电压:20V;峰值脉冲电流(Ipp):15A@8/20us;峰值脉冲功率(Ppp):150W;击穿电压(VBR):6.4V;; LCSC Part Name: 单向ESD 5V截止 峰值浪涌电流：15A@8/20us; Supplier Part: C85402; Manufacturer: Nexperia(安世); Supplier Footprint: DFN1006-2; JLCPCB Part Class: Extended Part; Datasheet: https://item.szlcsc.com/datasheet/PESD5V0S1UL%252C315/86575.html; Supplier: LCSC; Polarity: 单向; Reverse Stand-Off Voltage (Vrwm): 5V; Clamping Voltage: 20V; Peak Pulse Current (Ipp): 15A@8/20us; Peak Pulse Power Dissipation (Ppp): 150W; Voltage - Breakdown: 6.4V; Reverse Leakage Current (Ir): 100nA; Number of Channels: 单路; level of protection: IEC 61000-4-5；IEC 61000-4-2; Type: ESD; Junction Capacitance: 152pF; PCB Layer: Default; Assembly: FIT; Review: Engineering draft; MPN and footprint require review
J401 = SM05B-SRSS-TB(LF)(SN): 插针结构:1x5P;间距:1mm;安装方式:卧贴;参考系列:SH;总PIN数:5P;排数:1;每排PIN数:5;行距:-;额定电流:1A;触头材质:铜合金;触头镀层:锡;工作温度:-25℃~+85℃;; LCSC Part Name: 1x5P 间距:1mm 卧贴 系列:SH; Supplier Part: C136657; Manufacturer: JST; Supplier Footprint: SMD,P=1mm,卧贴; JLCPCB Part Class: Extended Part; Datasheet: https://item.szlcsc.com/datasheet/SM05B-SRSS-TB(LF)(SN)/147973.html; Supplier: LCSC; Pins Structure: 1x5P; Pitch: 1mm; Mounting Type: 卧贴; Reference Series: SH; Number of Pins: 5P; Number of Rows: 1; Number of PINs Per Row: 5; Current Rating: 1A; Contact Material: 铜合金; Contact Plating: 锡; Operating Temperature: -25℃~+85℃; Voltage Rating: 50V; Plastic Material: PA; Flame Retardant Rating: UL94V-0; Supplementary Features: 辅助焊脚; Color: 白色; Z-Height of the Board: 2.9mm; X-Length of Bottom Edge on Board (Spacing Line): 7mm; Y-Width of Bottom Edge on Board: 4.32mm; PCB Layer: Default; Assembly: FIT; Review: 5-wire straight-through PAT9125 module; pins 6/7 mechanical GND
J402 = SM02B-SRSS-TB(LF)(SN): 插针结构:1x2P;间距:1mm;安装方式:卧贴;参考系列:SH;总PIN数:2P;排数:1;每排PIN数:2;行距:-;额定电流:1A;触头材质:铜合金;触头镀层:锡;工作温度:-25℃~+85℃;; LCSC Part Name: 1x2P 间距:1mm 卧贴 系列:SH; Supplier Part: C160402; Manufacturer: JST; Supplier Footprint: SMD,P=1mm,卧贴; JLCPCB Part Class: Extended Part; Datasheet: https://item.szlcsc.com/datasheet/SM02B-SRSS-TB(LF)(SN)/171782.html; Supplier: LCSC; Pins Structure: 1x2P; Pitch: 1mm; Mounting Type: 卧贴; Reference Series: SH; Number of Pins: 2P; Number of Rows: 1; Number of PINs Per Row: 2; Current Rating: 1A; Contact Material: 铜合金; Contact Plating: 锡; Operating Temperature: -25℃~+85℃; Voltage Rating: 50V; Plastic Material: PA; Flame Retardant Rating: UL94V-0; Supplementary Features: 辅助焊脚; Color: 白色; Z-Height of the Board: 2.9mm; X-Length of Bottom Edge on Board (Spacing Line): 4mm; Y-Width of Bottom Edge on Board: 4.32mm; PCB Layer: Default; Assembly: FIT; Review: Engineering draft; MPN and footprint require review
R401 R404 = RC0603JR-070RL: 电阻类型:厚膜电阻;阻值:0Ω;精度:±5%;功率:100mW;工作电压:75V;温度系数:-;; LCSC Part Name: 厚膜电阻 0Ω ±5% 100mW; Supplier Part: C95177; Manufacturer: YAGEO(国巨); Supplier Footprint: 0603; JLCPCB Part Class: Extended Part; Datasheet: https://item.szlcsc.com/datasheet/RC0603JR-070RL/96378.html; Supplier: LCSC; Type: 厚膜电阻; Tolerance: ±5%; Power(Watts): 100mW; Voltage-Supply(Max): 75V; Operating Temperature: -55℃~+155℃; Review: MPN selected from EDA library; electrical/stock and final assembly validation recorded separately; PCB Layer: Default; Assembly: FIT; DesignValue: 0R
R405 R406 = RC0603FR-0747RL: 电阻类型:厚膜电阻;阻值:47Ω;精度:±1%;功率:100mW;工作电压:75V;温度系数:±100ppm/℃;; LCSC Part Name: 厚膜电阻 47Ω ±1% 100mW; Supplier Part: C114623; Manufacturer: YAGEO(国巨); Supplier Footprint: 0603; JLCPCB Part Class: Extended Part; Datasheet: https://item.szlcsc.com/datasheet/RC0603FR-0747RL/115867.html; Supplier: LCSC; Type: 厚膜电阻; Tolerance: ±1%; Power(Watts): 100mW; Voltage-Supply(Max): 75V; Temperature Coefficient: ±100ppm/℃; Operating Temperature: -55℃~+155℃; Review: MPN selected from EDA library; electrical/stock and final assembly validation recorded separately; PCB Layer: Default; Assembly: FIT; DesignValue: 47R
R408 R409 = RC0603FR-074K7L: 电阻类型:厚膜电阻;阻值:4.7kΩ;精度:±1%;功率:100mW;工作电压:75V;温度系数:±100ppm/℃;; LCSC Part Name: 厚膜电阻 4.7kΩ ±1% 100mW; Supplier Part: C99782; Manufacturer: YAGEO(国巨); Supplier Footprint: 0603; JLCPCB Part Class: Extended Part; Datasheet: https://item.szlcsc.com/datasheet/RC0603FR-074K7L/100996.html; Supplier: LCSC; Type: 厚膜电阻; Tolerance: ±1%; Power(Watts): 100mW; Voltage-Supply(Max): 75V; Temperature Coefficient: ±100ppm/℃; Operating Temperature: -55℃~+155℃; Review: MPN selected from EDA library; electrical/stock and final assembly validation recorded separately; PCB Layer: Default; Assembly: DNP; DesignValue: 4.7k DNP
R410 = RC0603FR-0710KL: 电阻类型:厚膜电阻;阻值:10kΩ;精度:±1%;功率:100mW;工作电压:75V;温度系数:±100ppm/℃;; LCSC Part Name: 厚膜电阻 10kΩ ±1% 100mW; Supplier Part: C98220; Manufacturer: YAGEO(国巨); Supplier Footprint: 0603; JLCPCB Part Class: Extended Part; Datasheet: https://item.szlcsc.com/datasheet/RC0603FR-0710KL/99429.html; Supplier: LCSC; Type: 厚膜电阻; Tolerance: ±1%; Power(Watts): 100mW; Voltage-Supply(Max): 75V; Temperature Coefficient: ±100ppm/℃; Operating Temperature: -55℃~+155℃; Review: MPN selected from EDA library; electrical/stock and final assembly validation recorded separately; PCB Layer: Default; Assembly: DNP; DesignValue: 10k DNP
U401 = jy901s: Supplier Part: C9900019525; Supplier Footprint: SMD; JLCPCB Part Class: Extended Part; Supplier: LCSC; PCB Layer: Default; Assembly: FIT; Review: HOLD: library symbol provisional; manufacturer pinout, voltage and solder footprint unverified; PCB transfer disabled
D501 = 19-217/R6C-AL1M2VY/3T: 灯头类型:-;发光颜色:红色;正向压降(Vf):2V;功率:62.5mW;正向电流:20mA;波长:631nm;二极管配置:独立二极管;透镜颜色:无色透明透镜;色温:-;发光强度:99mcd;发光角度:130°;载带方式:-;工作温度:-30℃~+85℃;; LCSC Part Name: 红灯; Supplier Part: C94869; Manufacturer: LITEON(光宝); Supplier Footprint: 0603; JLCPCB Part Class: Extended Part; Datasheet: https://item.szlcsc.com/datasheet/LTST-C190KRKT/96069.html; Supplier: LCSC; Illumination Color: 红色; Voltage - Forward(Vf): 2V; Power(Watts): 62.5mW; Forward Current: 20mA; Wavelength - Dominant: 631nm; Peak Wavelength: 639nm; Diode Configuration: 独立二极管; Lens Color: 无色透明透镜; Luminous Intensity: 99mcd; Viewing Angle: 130°; Operating Temperature: -30℃~+85℃; PCB Layer: Default; Assembly: FIT; Review: Engineering draft; MPN and footprint require review; DesignValue: RED SYS
D502 = 19-217/R6C-AL1M2VY/3T: 灯头类型:-;发光颜色:红色;正向压降(Vf):2V;功率:62.5mW;正向电流:20mA;波长:631nm;二极管配置:独立二极管;透镜颜色:无色透明透镜;色温:-;发光强度:99mcd;发光角度:130°;载带方式:-;工作温度:-30℃~+85℃;; LCSC Part Name: 红灯; Supplier Part: C94869; Manufacturer: LITEON(光宝); Supplier Footprint: 0603; JLCPCB Part Class: Extended Part; Datasheet: https://item.szlcsc.com/datasheet/LTST-C190KRKT/96069.html; Supplier: LCSC; Illumination Color: 红色; Voltage - Forward(Vf): 2V; Power(Watts): 62.5mW; Forward Current: 20mA; Wavelength - Dominant: 631nm; Peak Wavelength: 639nm; Diode Configuration: 独立二极管; Lens Color: 无色透明透镜; Luminous Intensity: 99mcd; Viewing Angle: 130°; Operating Temperature: -30℃~+85℃; PCB Layer: Default; Assembly: FIT; Review: Engineering draft; MPN and footprint require review; DesignValue: RED FAULT
D503 = 19-217/R6C-AL1M2VY/3T: 灯头类型:-;发光颜色:红色;正向压降(Vf):2V;功率:62.5mW;正向电流:20mA;波长:631nm;二极管配置:独立二极管;透镜颜色:无色透明透镜;色温:-;发光强度:99mcd;发光角度:130°;载带方式:-;工作温度:-30℃~+85℃;; LCSC Part Name: 红灯; Supplier Part: C94869; Manufacturer: LITEON(光宝); Supplier Footprint: 0603; JLCPCB Part Class: Extended Part; Datasheet: https://item.szlcsc.com/datasheet/LTST-C190KRKT/96069.html; Supplier: LCSC; Illumination Color: 红色; Voltage - Forward(Vf): 2V; Power(Watts): 62.5mW; Forward Current: 20mA; Wavelength - Dominant: 631nm; Peak Wavelength: 639nm; Diode Configuration: 独立二极管; Lens Color: 无色透明透镜; Luminous Intensity: 99mcd; Viewing Angle: 130°; Operating Temperature: -30℃~+85℃; PCB Layer: Default; Assembly: FIT; Review: Engineering draft; MPN and footprint require review; DesignValue: RED CHG
J501 = SMARTPEN_J501_TEST_8P_P1.27: PCB exposed copper test pads; no purchased component; LCSC Part Name: 1x6P 间距:1mm 卧贴 系列:SH; Manufacturer: PCB copper; Supplier Footprint: SMD,P=1mm,卧贴; JLCPCB Part Class: Extended Part; Datasheet: https://item.szlcsc.com/datasheet/SM06B-SRSS-TB(LF)(SN)/171785.html; Supplier: Not purchased; Pins Structure: 1x6P; Pitch: 1mm; Mounting Type: 卧贴; Reference Series: SH; Number of Pins: 6P; Number of Rows: 1; Number of PINs Per Row: 6; Current Rating: 1A; Contact Material: 铜合金; Contact Plating: 锡; Operating Temperature: -25℃~+85℃; Voltage Rating: 50V; Plastic Material: PA; Flame Retardant Rating: UL94V-0; Supplementary Features: 辅助焊脚; Color: 白色; Z-Height of the Board: 2.9mm; X-Length of Bottom Edge on Board (Spacing Line): 8mm; Y-Width of Bottom Edge on Board: 4.32mm; Assembly: PCB_ONLY; PCB Layer: Default; Review: UART0 TX/RX, EN, BOOT, GND, 3V45 VTref; not SWD; not power input
Q103 = BSS84-7-01-F: 数量:-;漏源电压(Vdss):-;连续漏极电流(Id):-;导通电阻(RDS(on)):-;耗散功率(Pd):-;阈值电压(Vgs(th)):-;; Supplier Part: C526484; Manufacturer: DIODES(美台); Supplier Footprint: SOT-23; JLCPCB Part Class: Extended Part; Supplier: LCSC; PCB Layer: Default; Assembly: FIT; Review: Engineering draft; MPN and footprint require review
R501-R503 = RC0603FR-073K3L: 电阻类型:厚膜电阻;阻值:3.3kΩ;精度:±1%;功率:100mW;工作电压:75V;温度系数:±100ppm/℃;; LCSC Part Name: 厚膜电阻 3.3kΩ ±1% 100mW; Supplier Part: C108078; Manufacturer: YAGEO(国巨); Supplier Footprint: 0603; JLCPCB Part Class: Extended Part; Datasheet: https://item.szlcsc.com/datasheet/RC0603FR-073K3L/109297.html; Supplier: LCSC; Type: 厚膜电阻; Tolerance: ±1%; Power(Watts): 100mW; Voltage-Supply(Max): 75V; Temperature Coefficient: ±100ppm/℃; Operating Temperature: -55℃~+155℃; Review: MPN selected from EDA library; electrical/stock and final assembly validation recorded separately; PCB Layer: Default; Assembly: FIT; DesignValue: 3.3k
R508 R509 = RT0603BRD07330KL: 电阻类型:薄膜电阻;阻值:330kΩ;精度:±0.1%;功率:100mW;工作电压:75V;温度系数:±25ppm/℃;; LCSC Part Name: 薄膜电阻 330kΩ ±0.1% 100mW; Supplier Part: C861327; Manufacturer: YAGEO(国巨); Supplier Footprint: 0603; JLCPCB Part Class: Extended Part; Datasheet: https://item.szlcsc.com/datasheet/RT0603BRD07330KL/921665.html; Supplier: LCSC; Type: 薄膜电阻; Tolerance: ±0.1%; Power(Watts): 100mW; Voltage-Supply(Max): 75V; Temperature Coefficient: ±25ppm/℃; Operating Temperature: -55℃~+155℃; Review: MPN selected from EDA library; electrical/stock and final assembly validation recorded separately; PCB Layer: Default; Assembly: FIT; DesignValue: 330k 0.1%

## Nets
3V45: C304.1 C307.1 C308.1 J501.6 R301.1 R315.1 R316.1 R317.1 R401.1 R404.1 R411.1 R503.1 R504.1 U302.8(VDD) U303.5(V+) ; also on sheet 1 2
GND: C301.2 C302.2 C303.2 C304.2 C305.2 C306.2 C307.2 C308.2 C309.2 C401.2 C402.2 C403.2 C404.2 C405.2 C501.2 D301.1 D401.2(A) D501.1(C) D502.1(C) J302.6 J302.7 J302.8 J401.5 J401.6 J401.7 J402.2 J402.3 J402.4 J501.5 J501.7 J501.8 Q102.2(S) Q104.2(S) Q301.2(S) R303.2 R305.2 R307.2 R310.2 R313.2 R507.2 R509.2 U301.4(V-) U302.1(ADDR) U302.3(GND) U302.6(AIN2) U302.7(AIN3) U303.2(GND) U303.3(NC) U401.5(GND) U401.8(GND) ; also on sheet 1 2
VBAT: Q103.2(S) R505.1 ; also on sheet 1
VBUS: R306.1 ; also on sheet 1
AFE_ADC_AUX: R319.2 ; also on sheet 2
AFE_RDY: R317.2 U302.2(ALERT/RDY) ; also on sheet 2
AFE_SCL: R316.2 U302.10(SCL) ; also on sheet 2
AFE_SDA: R315.2 U302.9(SDA) ; also on sheet 2
BAT_ADC: C501.1 R510.2 ; also on sheet 2
BAT_DIV: R508.2 R509.1 R510.1
BAT_MEAS: Q103.3(D) R508.1
BAT_NGATE: Q104.1(G) R506.2 R507.1
BAT_PGATE: Q103.1(G) Q104.3(D) R505.2
BAT_SENSE_EN: R506.1 ; also on sheet 2
BOOT_N: J501.4 ; also on sheet 2
CHG_STAT2: D503.1(C) ; also on sheet 1 2
E_SLEEVE: J301.1 R309.1
E_TIP: J301.2 R308.2
EXC_EN: Q301.3(D) R304.2 R305.1 U303.6(IN)
GSR_ADC: C306.1 J302.5 R314.2 R319.1 U302.4(AIN0)
GSR_EN: R304.1 ; also on sheet 2
GSR_F: C305.1 R311.2 U301.5(IN B+)
GSR_N: R312.1 R313.1 U301.6(IN B-)
GSR_OUT: J302.4 R312.2 R314.1 U301.7(OUT B)
GSR_S: D301.3 J302.3 R309.2 R310.1 R311.1
IMU_HOST_RX: R403.2 ; also on sheet 2
IMU_HOST_TX: R402.1 ; also on sheet 2
IMU_RX: R402.2 U401.3(RX)
IMU_TX: R403.1 U401.4(TX)
LED_CHG_A: D503.2(A) R503.2
LED_FAULT: R502.1 ; also on sheet 2
LED_FAULT_A: D502.2(A) R502.2
LED_SYS: R501.1 ; also on sheet 2
LED_SYS_A: D501.2(A) R501.2
MCU_EN: J501.3 ; also on sheet 2
OPT_MOTION: R407.1 ; also on sheet 2
OPT_MOTION_C: J401.4 R407.2 R410.2
OPT_SCL: R405.1 ; also on sheet 2
OPT_SCL_C: J401.2 R405.2 R408.2
OPT_SDA: R406.1 ; also on sheet 2
OPT_SDA_C: J401.3 R406.2 R409.2
TIP_RAW: D401.1(C) J402.1 R411.2 R412.1
TIP_SW: C405.1 R412.2 ; also on sheet 2
UART0_RX: J501.2 ; also on sheet 2
UART0_TX: J501.1 ; also on sheet 2
USB_ABSENT: Q102.3(D) R504.2 ; also on sheet 2
USB_DET_GATE: Q102.1(G) Q301.1(G) R306.2 R307.1
VAA: C301.1 C302.1 D301.2 R301.2 R302.1 U301.8(V+)
VEX: J302.2 R308.1 R318.1 U303.4(COM)
VEX_BUF: U301.1(OUT A) U301.2(IN A-) U303.1(NO)
VEX_MON: C309.1 R318.2 U302.5(AIN1)
VIMU: C401.1 C402.1 R401.2 U401.2(VCC) U401.11(VCC)
VOPT: C403.1 C404.1 J401.1 R404.2 R408.1 R409.1 R410.1
VREF: C303.1 J302.1 R302.2 R303.1 U301.3(IN A+)

Not connected (* = marked no-connect by the designer): J301 3* 4*; U401 1(D0)* 6(D1)* 7(D3)* 9(SDA)* 10(SCL)* 12(D2)*

## Notes on the sheets
sheet 3
- 03  皮肤电激励、模拟调理与 ADS1115
- 0.5 V 候选激励 / 默认关闭
- 两电极限流 / 同相放大 ×15
- I2C ADC / RDY / 测试点
- USB 接入硬件拉低 EXC_EN
- Vout = 15 x VEX x 100k / (Rskin + 300k)。
  VEX约0.523V；短路输出约2.61V、回路约1.74uA。
  电极两侧各100k；Sleeve不直接接地。
  D301默认DNP；用实际插头核对接点并先用电阻盒标定。
- ADS1115 地址 0x48；AIN0主通道，AIN1监测激励。
  默认量程 ±4.096V；250 SPS单次转换，目标100Hz。
  监测激励时切换MUX，记录采样时刻与滤波延迟。
  不能把统一时间戳等同于所有传感器零延迟。
- U303 低电平: COM接GND；高电平: COM接0.5V。
  电池供电测量；USB充电/调试前移除人体电极。
  本电路没有医疗隔离，限流不替代隔离。
- SMARTPEN | REAR BLE V0.2D3 | 2026-10-05 | SHEET 3/5 | 电池及制造条件未闭合 / 未放行 | DNP=不装
sheet 4
- 04  JY901S 直接焊装、前光学子板与独立微动
- 完整 JY901S 裸模块 / 无排针 / 保留屏蔽罩
- 前部光学子板 / 独立 I2C
- 笔芯尾端独立微动
- JY901S 裸模块直接焊装，12脚映射已核对官方手册。
  U401/R401/R402/R403为FIT；R402/R403均1k。
  焊盘与引脚1方向须做1:1实配，焊接温度按厂商要求。
  UART交叉：主控TX到模块RX；模块TX到主控RX。
  报文完成时刻不等于内部采样时刻，需实测延迟。
- 常开触点：落笔接地，抬笔为高。
  原始边沿时间戳 + 固件消抖。
  微动单独接主板，不焊在光学板上。
- J401五芯顺序: 1 VDD(VOPT) / 2 SCL / 3 SDA / 4 MOT / 5 GND。
  PAT9125EL-TKIT成品模块，I2C地址0x75；针6/7仅机械固定接地。
  SCL=GPIO8 / SDA=GPIO9 / MOT=GPIO10；R408/409/410保持DNP。
  五芯排线按针号直通，模块端按标注焊接；VOPT约3.45V。
- Front optical: purchased PAT9125EL-TKIT module via J401; no optical IC populated on rear PCB.
- D3: J402开口朝长边-Y；其余JST接口朝笔头-X。线束不得直穿邻座，侧边插头包络计入新外壳。
- SMARTPEN | REAR BLE V0.2D3 | 2026-10-05 | SHEET 4/5 | 电池及制造条件未闭合 / 未放行 | DNP=不装
sheet 5
- 05  状态显示、调试与电池电压采集
- LED / 低占空比显示
- USB 接入检测 / 5V 不直连 MCU
- USB_ABSENT=高：无VBUS；低：USB已插入。
  门极分压 R306/R307 见03页；Q301同时禁止GSR激励。
- D501: 启动/BLE连接/采集，用不同闪烁编码。
  D502: 故障；D503: STAT2低电平亮（充电/锁存故障）。
  完整充电状态由STAT1+STAT2联合解码。
  按BQ25185真值表处理，不只用单灯判满电。
- 可关断电池分压 / 防关机倒灌
- SWD / RESET / BOOT 裸测试焊盘
- 新模块首次必须SWD烧录；J501为裸测试焊盘。
  写入引导程序后才可USB DFU；SW201为软件入口。
- P0.25 / BAT_SENSE_EN高电平使能分压；等100ms后采样。
  VBAT约2倍ADC值，需校准。Q103断开ADC直流路径，避免关机倒灌。
- SMARTPEN | REAR BLE V0.2D3 | 2026-10-05 | SHEET 5/5 | 电池及制造条件未闭合 / 未放行 | DNP=不装
